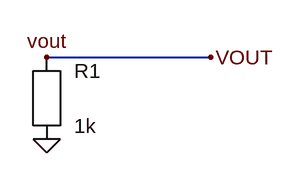
[diagram p0: schematic label_case_one_wire.asc]
label_case_one_wire.asc, the LTspice schematic file:
Version 4
SHEET 1 880 680
WIRE 96 96 288 96
FLAG 96 96 vout
FLAG 288 96 VOUT
FLAG 96 192 0
SYMBOL res 96 144 R0
SYMATTR InstName R1
SYMATTR Value 1k

The netlist it stands for:
* label_case_one_wire.asc
R1 vout 0 1k
.backanno
.end